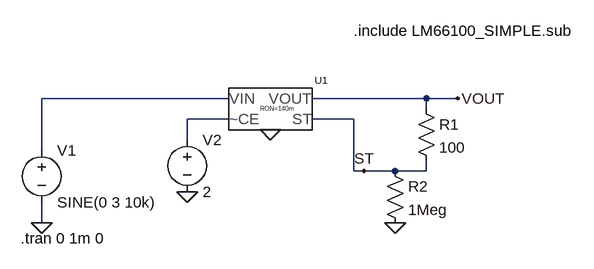
[diagram p0: schematic ideal-diode-test.asc]
ideal-diode-test.asc, the LTspice schematic file:
Version 4.1
SHEET 1 880 680
WIRE 80 144 -208 144
WIRE 384 144 208 144
WIRE 432 144 384 144
WIRE 384 160 384 144
WIRE 80 176 16 176
WIRE 272 176 208 176
WIRE 16 208 16 176
WIRE -208 224 -208 144
WIRE 272 256 272 176
WIRE 288 256 272 256
WIRE 336 256 288 256
WIRE 384 256 384 240
WIRE 384 256 336 256
WIRE -208 336 -208 304
FLAG -208 336 0
FLAG 288 256 ST
FLAG 432 144 VOUT
FLAG 144 192 0
FLAG 336 336 0
FLAG 16 288 0
SYMBOL voltage -208 208 R0
WINDOW 123 0 0 Left 0
WINDOW 39 0 0 Left 0
SYMATTR InstName V1
SYMATTR Value SINE(0 3 10k)
SYMBOL res 368 144 R0
SYMATTR InstName R1
SYMATTR Value 100
SYMBOL custom\\LM66100\\LM66100_SIMPLE 128 160 R0
WINDOW 39 0 0 Left 0
SYMATTR InstName U1
SYMATTR SpiceLine RON=140m
SYMBOL res 320 240 R0
SYMATTR InstName R2
SYMATTR Value 1Meg
SYMBOL voltage 16 192 R0
SYMATTR InstName V2
SYMATTR Value 2
TEXT -240 360 Left 2 !.tran 0 1m 0
TEXT 272 40 Left 2 !.include LM66100_SIMPLE.sub

The netlist it stands for:
* ideal-diode-test.asc
V1 N001 0 SINE(0 3 10k)
R1 VOUT ST 100
X§U1 N001 VOUT N002 ST 0 LM66100_SIMPLE params: RON=140m  ; pins VIN VOUT CE ST G
R2 ST 0 1Meg
V2 N002 0 2
.tran 0 1m 0
.include LM66100_SIMPLE.sub
.backanno
.end